# EasyEDA Pro project V5_R03_PowerCarrier.epro

# Board V5_R03_PowerCarrier
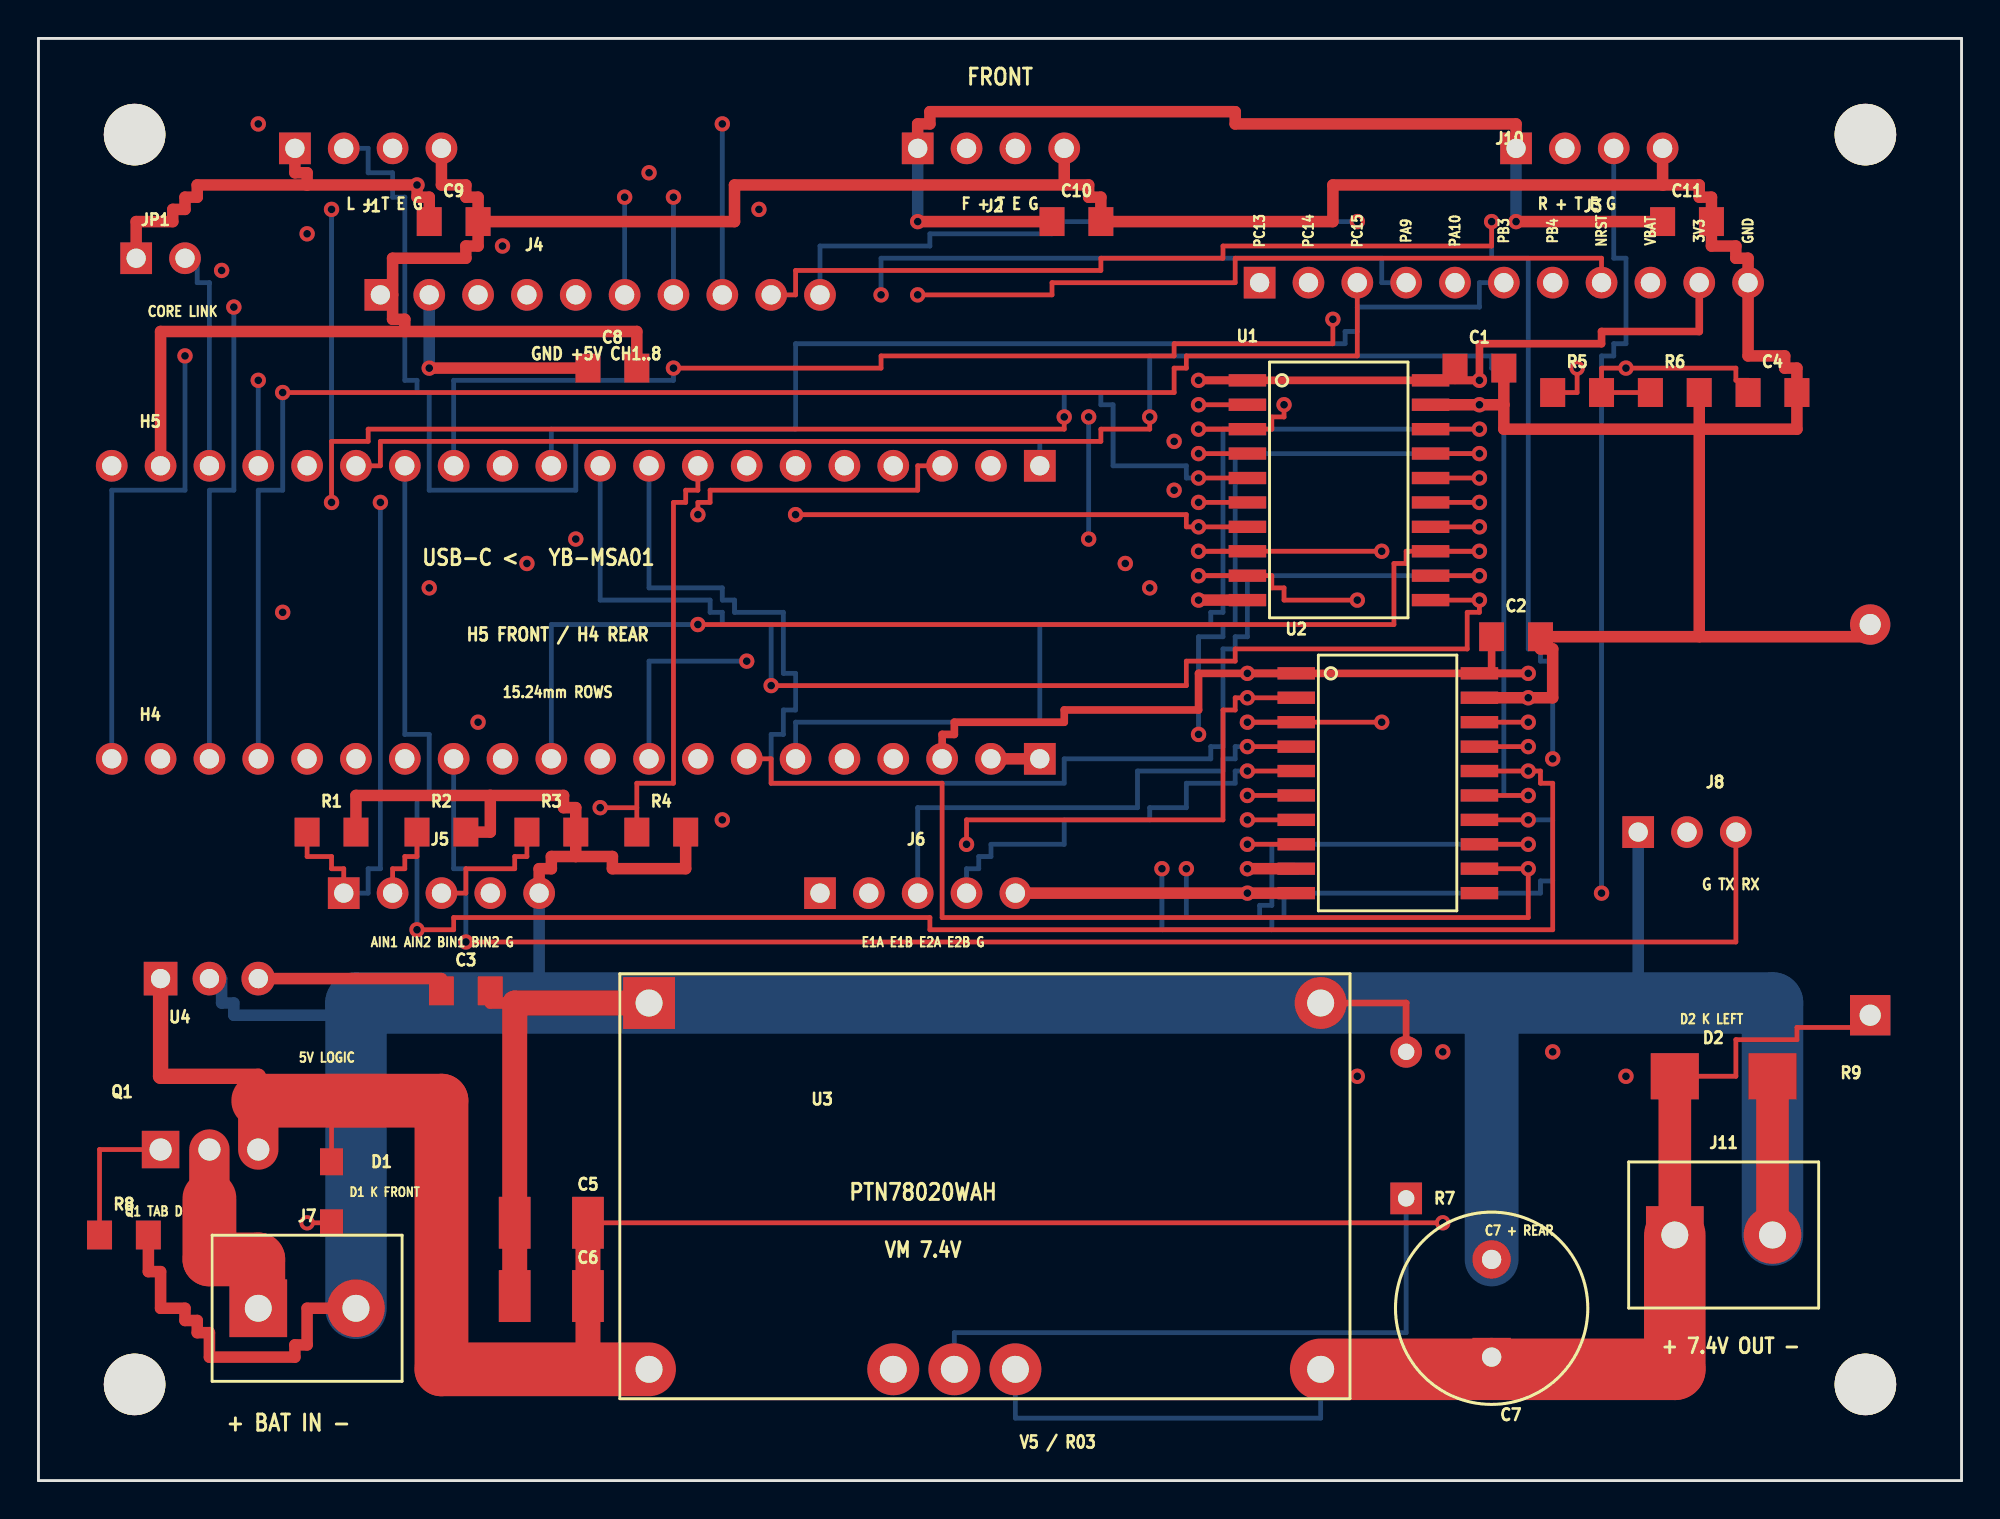
[diagram p0: board, top side]
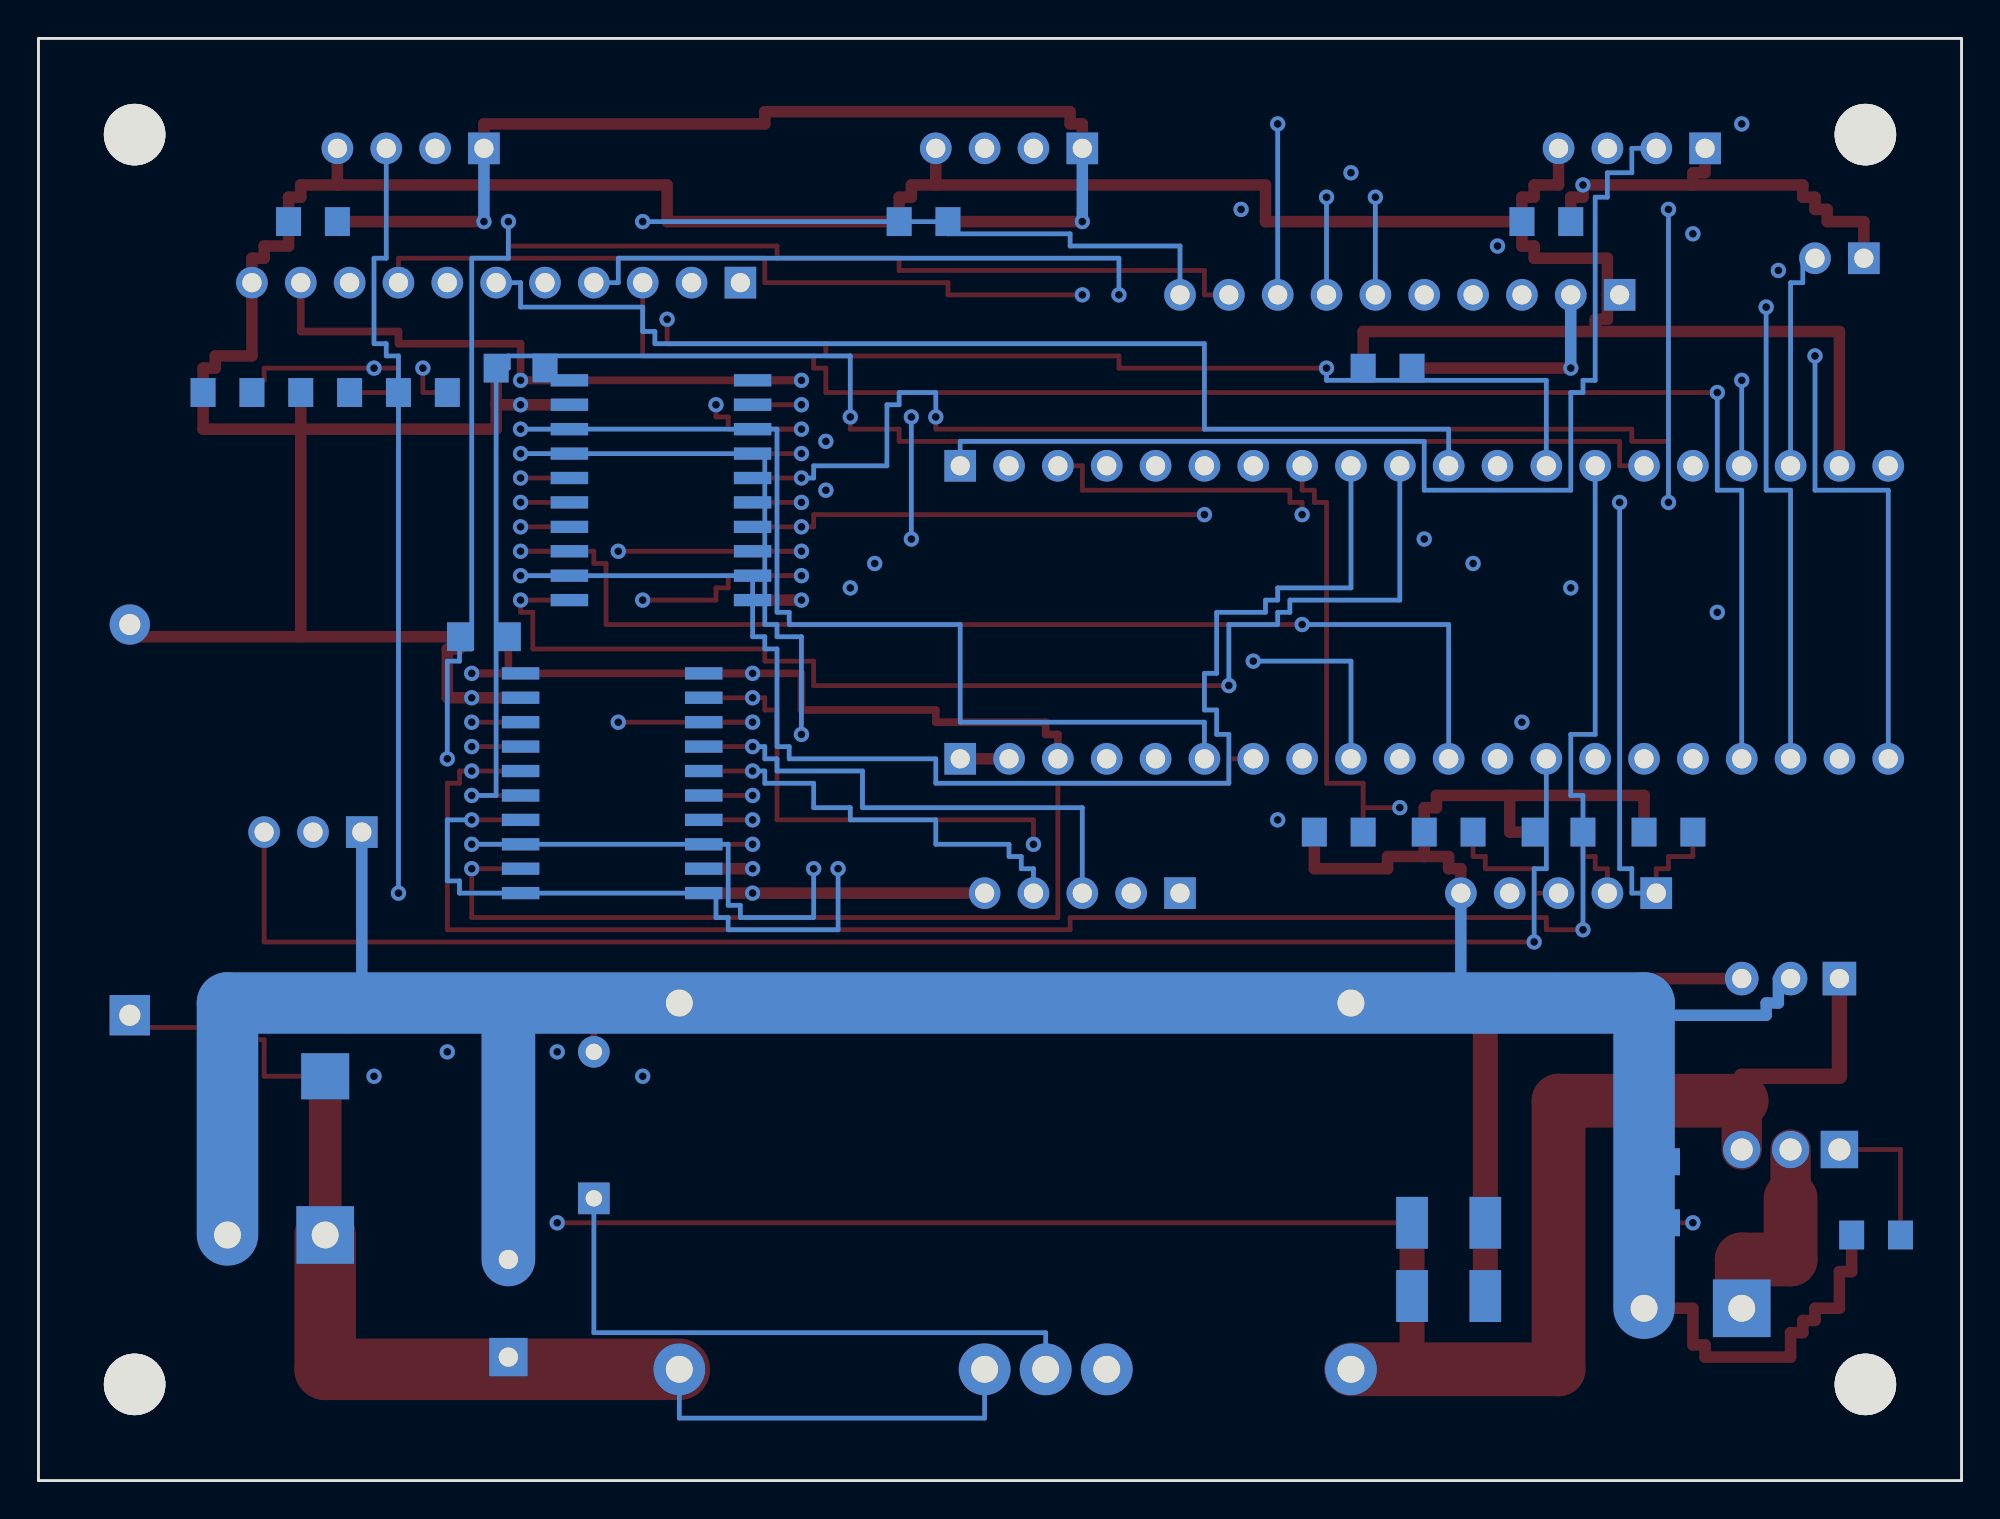
[diagram p1: board, bottom side, seen from below]

Outline 100 x 75 mm; copper layers: Top Layer, In1.Cu, In2.Cu, Bottom Layer. Coordinates in mm from the lower left corner of the outline.
Outline path: 0,75 100,75 100,0 0,0 0,75
Stack: Top Layer 0.035mm / Bottom Layer 0.035mm

## Design rules (mm)
spacing copperThickness1oz (default): track to track 0.102, other pairs 0.152 to 0.3
track width copperThickness1oz (default): min 0.2, default 0.25, max 3.5
differential pair differentialPair (default): width min 0.127, default 2.54, max 2.54; gap min 0.127, default 0.152

## Placement (name value [footprint] x y rotation side)
C1  100n  [C1_100n]  74.93 57.86 0 top
C2  100n  [C2_100n]  76.84 43.89 0 top
C3  10u/10V  [C3_10u/10V]  22.22 25.47 0 top
C4  100n  [C4_100n]  90.17 56.58 0 top
C5  10u_50V_X7R_1210  [C5_10u_50V_X7R_1210]  28.57 13.41 0 top
C6  10u_50V_X7R_1210  [C6_10u_50V_X7R_1210]  28.57 9.59 0 top
C7  EEUFC1V331_330u_35V  [C7_EEUFC1V331_330u_35V]  75.56 6.42 0 top
C8  100n  [C8_100n]  29.84 57.86 0 top
C9  100n  [C9_100n]  21.59 65.47 0 top
C10  100n  [C10_100n]  53.97 65.47 0 top
C11  100n  [C11_100n]  85.72 65.47 0 top
D1  BZT52C12_SOD123  [D1_BZT52C12_SOD123]  15.24 16.58 0 top
D2  SMBJ8.0A  [D2_SMBJ8.0A]  85.09 21.03 0 top
H4  SOCKET_1x20  [H4_SOCKET_1x20]  3.81 37.53 0 top
H5  SOCKET_1x20  [H5_SOCKET_1x20]  3.81 52.78 0 top
J1  SONAR_L  [J1_SONAR_L]  13.33 69.28 0 top
J2  SONAR_F  [J2_SONAR_F]  45.72 69.28 0 top
J3  SONAR_R  [J3_SONAR_R]  76.84 69.28 0 top
J4  GANV005_M0  [J4_GANV005_M0]  17.78 61.67 0 top
J5  D157B_CONTROL  [J5_D157B_CONTROL]  15.88 30.55 0 top
J6  D157B_ENCODER  [J6_D157B_ENCODER]  40.64 30.55 0 top
J7  BATTERY_IN_5.08  [J7_BATTERY_IN_5.08]  11.43 8.96 0 top
J8  RDK_UART_3V3  [J8_RDK_UART_3V3]  83.19 33.72 0 top
J10  EXPANSION  [J10_EXPANSION]  63.5 62.3 0 top
J11  VM_OUT_5.08  [J11_VM_OUT_5.08]  85.09 12.77 0 top
JP1  CORE_POWER_LINK  [JP1_CORE_POWER_LINK]  5.08 63.57 0 top
MH1  M3  [MountingHole]  5 70 0 top
MH2  M3  [MountingHole]  95 70 0 top
MH3  M3  [MountingHole]  5 5 0 top
MH4  M3  [MountingHole]  95 5 0 top
Q1  IRF4905PbF_TO220  [Q1_IRF4905PbF_TO220]  6.35 17.22 0 top
R1  47k  [R1_47k]  15.24 33.72 0 top
R2  47k  [R2_47k]  20.95 33.72 0 top
R3  47k  [R3_47k]  26.67 33.72 0 top
R4  47k  [R4_47k]  32.38 33.72 0 top
R5  47k  [R5_47k]  80.01 56.58 0 top
R6  10k  [R6_10k]  85.09 56.58 0 top
R7  7.50k_0.1pct  [R7_7.50k_0.1pct]  71.12 14.68 0 top
R8  10k  [R8_10k]  4.44 12.77 0 top
R9  68R_3W_flameproof  [R9_68R_3W_flameproof]  95.25 24.2 0 top
U1  SN74LVC245ADW  [U1_SN74LVC245ADW]  62.87 57.22 0 top
U2  SN74LVC245ADW  [U2_SN74LVC245ADW]  65.41 41.98 0 top
U3  PTN78020WAH_EUK  [U3_PTN78020WAH_EUK]  31.75 24.83 0 top
U4  TSR_1-2450  [U4_TSR_1-2450]  6.35 26.11 0 top

## Footprints (pads in the part's own frame, mm; a bottom-side part is the same pattern mirrored in y, then rotated)
C1_100n
  rect 1.3x1.5 hole 0.001: 1(-1.27,0) 2(1.27,0)
C2_100n
  rect 1.3x1.5 hole 0.001: 1(-1.27,0) 2(1.27,0)
C3_10u/10V
  rect 1.3x1.5 hole 0.001: 1(-1.27,0) 2(1.27,0)
C4_100n
  rect 1.3x1.5 hole 0.001: 1(-1.27,0) 2(1.27,0)
C5_10u_50V_X7R_1210
  rect 1.65x2.7 hole 0.001: 1(0,0) 2(-3.81,0)
C6_10u_50V_X7R_1210
  rect 1.65x2.7 hole 0.001: 1(0,0) 2(-3.81,0)
C7_EEUFC1V331_330u_35V
  rect 2x2 hole 1: 1(0,0)
  round 2 hole 1: 2(0,5.08)
C8_100n
  rect 1.3x1.5 hole 0.001: 1(-1.27,0) 2(1.27,0)
C9_100n
  rect 1.3x1.5 hole 0.001: 1(-1.27,0) 2(1.27,0)
C10_100n
  rect 1.3x1.5 hole 0.001: 1(-1.27,0) 2(1.27,0)
C11_100n
  rect 1.3x1.5 hole 0.001: 1(-1.27,0) 2(1.27,0)
D1_BZT52C12_SOD123
  rect 1.2x1.4 hole 0.001: 1(0,0) 2(0,-3.175)
D2_SMBJ8.0A
  rect 2.5x2.4 hole 0.001: 1(0,0) 2(5.08,0)
H4_SOCKET_1x20
  rect 1.65x1.65 hole 1: 1(48.26,0)
  round 1.65 hole 1: 2(45.72,0) 3(43.18,0) 4(40.64,0) 5(38.1,0) 6(35.56,0) 7(33.02,0) 8(30.48,0) 9(27.94,0) 10(25.4,0) 11(22.86,0) 12(20.32,0) 13(17.78,0) 14(15.24,0) 15(12.7,0) 16(10.16,0) 17(7.62,0) 18(5.08,0) 19(2.54,0) 20(0,0)
H5_SOCKET_1x20
  rect 1.65x1.65 hole 1: 1(48.26,0)
  round 1.65 hole 1: 2(45.72,0) 3(43.18,0) 4(40.64,0) 5(38.1,0) 6(35.56,0) 7(33.02,0) 8(30.48,0) 9(27.94,0) 10(25.4,0) 11(22.86,0) 12(20.32,0) 13(17.78,0) 14(15.24,0) 15(12.7,0) 16(10.16,0) 17(7.62,0) 18(5.08,0) 19(2.54,0) 20(0,0)
J1_SONAR_L
  rect 1.65x1.65 hole 1: 1(0,0)
  round 1.65 hole 1: 2(2.54,0) 3(5.08,0) 4(7.62,0)
J2_SONAR_F
  rect 1.65x1.65 hole 1: 1(0,0)
  round 1.65 hole 1: 2(2.54,0) 3(5.08,0) 4(7.62,0)
J3_SONAR_R
  rect 1.65x1.65 hole 1: 1(0,0)
  round 1.65 hole 1: 2(2.54,0) 3(5.08,0) 4(7.62,0)
J4_GANV005_M0
  rect 1.65x1.65 hole 1: 1(0,0)
  round 1.65 hole 1: 2(2.54,0) 3(5.08,0) 4(7.62,0) 5(10.16,0) 6(12.7,0) 7(15.24,0) 8(17.78,0) 9(20.32,0) 10(22.86,0)
J5_D157B_CONTROL
  rect 1.65x1.65 hole 1: 1(0,0)
  round 1.65 hole 1: 2(2.54,0) 3(5.08,0) 4(7.62,0) 5(10.16,0)
J6_D157B_ENCODER
  rect 1.65x1.65 hole 1: 1(0,0)
  round 1.65 hole 1: 2(2.54,0) 3(5.08,0) 4(7.62,0) 5(10.16,0)
J7_BATTERY_IN_5.08
  rect 3x3 hole 1.4: 1(0,0)
  round 3 hole 1.4: 2(5.08,0)
J8_RDK_UART_3V3
  rect 1.65x1.65 hole 1: 1(0,0)
  round 1.65 hole 1: 2(2.54,0) 3(5.08,0)
J10_EXPANSION
  rect 1.65x1.65 hole 1: 1(0,0)
  round 1.65 hole 1: 2(2.54,0) 3(5.08,0) 4(7.62,0) 5(10.16,0) 6(12.7,0) 7(15.24,0) 8(17.78,0) 9(20.32,0) 10(22.86,0) 11(25.4,0)
J11_VM_OUT_5.08
  rect 3x3 hole 1.4: 1(0,0)
  round 3 hole 1.4: 2(5.08,0)
JP1_CORE_POWER_LINK
  rect 1.65x1.65 hole 1: 1(0,0)
  round 1.65 hole 1: 2(2.54,0)
MountingHole
  round 3.2 hole 3.2: (0,0)
Q1_IRF4905PbF_TO220
  rect 1.95x1.95 hole 1.15: 1(0,0)
  round 1.95 hole 1.15: 2(2.54,0) 3(5.08,0)
R1_47k
  rect 1.3x1.5 hole 0.001: 1(-1.27,0) 2(1.27,0)
R2_47k
  rect 1.3x1.5 hole 0.001: 1(-1.27,0) 2(1.27,0)
R3_47k
  rect 1.3x1.5 hole 0.001: 1(-1.27,0) 2(1.27,0)
R4_47k
  rect 1.3x1.5 hole 0.001: 1(-1.27,0) 2(1.27,0)
R5_47k
  rect 1.3x1.5 hole 0.001: 1(-1.27,0) 2(1.27,0)
R6_10k
  rect 1.3x1.5 hole 0.001: 1(-1.27,0) 2(1.27,0)
R7_7.50k_0.1pct
  rect 1.65x1.65 hole 0.85: 1(0,0)
  round 1.65 hole 0.85: 2(0,7.62)
R8_10k
  rect 1.3x1.5 hole 0.001: 1(-1.27,0) 2(1.27,0)
R9_68R_3W_flameproof
  rect 2.1x2.1 hole 1.1: 1(0,0)
  round 2.1 hole 1.1: 2(0,20.32)
U1_SN74LVC245ADW
  rect 1.95x0.64 hole 0.001: 1(0,0) 2(0,-1.27) 3(0,-2.54) 4(0,-3.81) 5(0,-5.08) 6(0,-6.35) 7(0,-7.62) 8(0,-8.89) 9(0,-10.16) 10(0,-11.43) 11(9.525,-11.43) 12(9.525,-10.16) 13(9.525,-8.89) 14(9.525,-7.62) 15(9.525,-6.35) 16(9.525,-5.08) 17(9.525,-3.81) 18(9.525,-2.54) 19(9.525,-1.27) 20(9.525,0)
U2_SN74LVC245ADW
  rect 1.95x0.64 hole 0.001: 1(0,0) 2(0,-1.27) 3(0,-2.54) 4(0,-3.81) 5(0,-5.08) 6(0,-6.35) 7(0,-7.62) 8(0,-8.89) 9(0,-10.16) 10(0,-11.43) 11(9.525,-11.43) 12(9.525,-10.16) 13(9.525,-8.89) 14(9.525,-7.62) 15(9.525,-6.35) 16(9.525,-5.08) 17(9.525,-3.81) 18(9.525,-2.54) 19(9.525,-1.27) 20(9.525,0)
U3_PTN78020WAH_EUK
  rect 2.7x2.7 hole 1.4: 1(0,0)
  round 2.7 hole 1.4: 2(0,-19.05) 3(12.7,-19.05) 4(15.875,-19.05) 5(19.05,-19.05) 6(34.925,-19.05) 7(34.925,0)
U4_TSR_1-2450
  rect 1.75x1.75 hole 1: 1(0,0)
  round 1.75 hole 1: 2(2.54,0) 3(5.08,0)

## Nets
3V3: C1.1 C2.1 H4.3 H5.20 J10.10 U1.1 U1.20 U2.1 U2.20
5V: C3.1 C8.1 C9.1 C10.1 C11.1 J1.1 J2.1 J3.1 J4.2 JP1.1 U4.3
GND: C1.2 C2.2 C3.2 C4.2 C5.2 C6.2 C7.2 C8.2 C9.2 C10.2 C11.2 D2.2 H4.1 H4.2 H5.19 J1.4 J2.4 J3.4 J4.1 J5.5 J6.5 J7.2 J8.1 J10.11 J11.2 R1.2 R2.2 R3.2 R4.2 R6.2 R7.2 R8.2 R9.2 U1.10 U1.19 U2.9 U2.10 U2.19 U3.1 U3.7 U4.2
VBAT: H4.20 J10.9
VIN_PROT: C5.1 C6.1 D1.1 Q1.3 R5.1 U3.2 U4.1
BAT_SW: J7.1 Q1.2
CH1: J4.3 U1.2
CH2: J4.4 U1.3
CH3: J4.5 U1.4
CH4: J4.6 U1.5
CH5: J4.7 U1.6
CH6: J4.8 U1.7
CH7: J4.9 U1.8
CH8: J4.10 U1.9
CORE_5V: H5.18 JP1.2
E1A: J6.1 U2.2
E1B: J6.2 U2.3
E2A: J6.3 U2.4
E2B: J6.4 U2.5
EF: J2.3 U2.7
EL: J1.3 U2.6
ER: J3.3 U2.8
INH_NC: U3.3
NC_U2_B8: U2.11
NRST: H4.4 J10.8
PA0: H4.16 J5.2 R2.1
PA1: H4.15 J5.3 R3.1
PA2: H4.14 J8.2
PA3: H4.13 J8.3
PA4: C4.1 H4.12 R5.2 R6.1
PA5: H4.11 U1.13
PA6: H4.10 U2.18
PA7: H4.9 U2.17
PA8: H5.5 J5.1 R1.1
PA9: H5.6 J10.4
PA10: H5.7 J10.5
PA11: H5.8 J5.4 R4.1
PA12: H5.9 U1.12
PA15: H5.10 U1.11
PB0: H4.8 J3.2
PB1: H4.7 U2.12
PB3: H5.11 J10.6
PB4: H5.12 J10.7
PB5: H5.13 U1.14
PB6: H5.14 U2.16
PB7: H5.15 U2.15
PB8: H5.16 U1.16
PB9: H5.17 U1.15
PB10: H4.6 U1.18
PB11: H4.5 U1.17
PB12: H5.1 J1.2
PB13: H5.2 U2.14
PB14: H5.3 J2.2
PB15: H5.4 U2.13
PC13: H4.19 J10.1
PC14: H4.18 J10.2
PC15: H4.17 J10.3
PGATE: D1.2 Q1.1 R8.1
VADJ: R7.1 U3.4
VM7V4: C7.1 D2.1 J11.1 R9.1 U3.5 U3.6

## Via types
v1: diameter 0.8, hole 0.4, Top Layer to Bottom Layer, 105 vias

## Routing (per net, layer and track width the routed paths; a pad name or vN(x,y) marks a point on that pad's centre or on a via; arc(x,y) is an arc through that point)
3V3: length 157.5
  Top Layer w0.4: J10.10 86.36,59.76 81.28,59.76 81.28,59.12 74.93,59.12 v1(74.93,57.22) ; U2.20 v1(77.47,41.98) v1(62.87,41.98) ; v1(74.93,57.22) U1.20 ; v1(74.93,57.22) 73.66,57.22 ; C1.1 73.66,57.22 ; 73.66,57.22 v1(60.32,57.22) U1.1 ; H4.3 46.99,38.81 47.62,38.81 47.62,39.44 53.34,39.44 53.34,40.08 60.32,40.08 60.32,41.98 v1(62.87,41.98) ; v1(62.87,41.98) U2.1 ; C2.1 75.56,41.98
  In1.Cu w0.4: v1(62.87,41.98) U1.1 v1(60.32,57.22)
  In2.Cu w0.4: H5.20 3.81,55.31 21.59,55.31 21.59,55.95 41.28,55.95 41.28,57.22 v1(60.32,57.22)
5V: length 187.3
  Top Layer w0.6: 84.46,65.47 v1(76.84,65.47) ; C9.1 20.32,66.75 19.69,66.75 v1(19.69,67.38) 13.97,67.38 ; 13.97,67.38 13.97,68.02 13.33,68.02 J1.1 ; 13.97,67.38 8.25,67.38 8.25,66.75 7.62,66.75 7.62,66.11 6.98,66.11 6.98,65.47 5.08,65.47 JP1.1 ; C8.1 v1(20.32,57.86) ; U4.3 20.95,26.11 C3.1 ; C10.1 v1(45.72,65.47) ; J2.1 45.72,70.56 46.35,70.56 46.35,71.19 62.23,71.19 62.23,70.56 76.84,70.56 J3.1
  In1.Cu w0.6: J4.2 19.69,61.67 v1(19.69,67.38) ; U4.3 10.8,26.11 10.8,27.38 10.16,27.38 10.16,28.01 1.91,28.01 1.91,54.05 2.54,54.05 2.54,54.68 5.08,54.68 JP1.1
  In2.Cu w0.6: v1(19.69,67.38) 29.21,67.38 29.21,69.28 J2.1
  Bottom Layer w0.6: v1(20.32,57.86) J4.2 ; v1(45.72,65.47) J2.1 ; v1(76.84,65.47) J3.1
GND: length 502.3
  Top Layer w0.35: U3.7 71.12,24.83 R7.2
  Top Layer w0.6: 27.94,32.45 26.67,32.45 26.67,31.82 26.03,31.82 J5.5 ; 27.94,32.45 29.84,32.45 29.84,31.82 33.66,31.82 R4.2 ; 27.94,32.45 R3.2 27.94,35 27.31,35 27.31,35.63 23.5,35.63 ; 76.2,55.95 76.2,54.68 91.44,54.68 C4.2 91.44,57.86 90.81,57.86 90.81,58.49 88.9,58.49 J10.11 88.9,63.57 88.26,63.57 88.26,64.2 87,64.2 C11.2 87,66.75 86.36,66.75 86.36,67.38 84.46,67.38 ; 76.2,55.95 C1.2 ; 76.2,55.95 v1(74.93,55.95) U1.19 ; H5.19 6.35,59.76 19.05,59.76 ; 84.46,67.38 67.31,67.38 67.31,65.47 C10.2 55.25,66.75 54.61,66.75 54.61,67.38 53.34,67.38 ; 84.46,67.38 J3.4 ; U2.10 v1(62.87,30.55) J6.5 ; U1.10 v1(60.32,45.79) ; 53.34,67.38 36.19,67.38 36.19,65.47 C9.2 ; 53.34,67.38 J2.4 ; J4.1 18.42,61.67 ; 18.42,61.67 18.42,63.57 22.22,63.57 22.22,64.2 22.86,64.2 C9.2 ; 18.42,61.67 18.42,60.39 19.05,60.39 19.05,59.76 ; 23.5,35.63 23.5,33.72 R2.2 ; 23.5,35.63 16.51,35.63 R1.2 ; C8.2 31.12,59.76 19.05,59.76 ; H4.1 H4.2 ; C9.2 22.86,66.75 22.22,66.75 22.22,67.38 20.95,67.38 J1.4 ; U2.9 v1(62.87,31.82) ; 5.72,12.77 5.72,10.87 6.35,10.87 6.35,8.96 7.62,8.96 7.62,8.32 8.25,8.32 8.25,7.69 8.89,7.69 8.89,6.42 13.33,6.42 13.33,7.06 13.97,7.06 13.97,8.96 J7.2 ; 24.77,24.83 23.5,24.83 23.5,25.47 ; R6.2 86.36,43.89 ; R9.2 95.25,43.89 78.1,43.89 78.1,43.25 78.74,43.25 78.74,40.71 v1(77.47,40.71) U2.19
  Top Layer w1.3: C6.2 24.77,24.83 U3.1
  Top Layer w1.7: D2.2 J11.2
  In1.Cu w0.6: U3.7 62.87,24.83 v1(62.87,30.55) v1(62.87,31.82) 61.59,31.82 61.59,45.79 v1(60.32,45.79) ; J8.1 83.19,40.71 v1(77.47,40.71) ; J6.5 52.07,30.55 H4.1
  Bottom Layer w0.6: 16.51,24.2 10.16,24.2 10.16,24.83 9.53,24.83 9.53,26.11 U4.2 ; J8.1 83.19,24.83 ; J5.5 26.03,24.83
  Bottom Layer w2.8: C7.2 75.56,24.83
  Bottom Layer w3.2: J7.2 16.51,24.83 90.17,24.83 J11.2
VBAT: length 104.8
  In2.Cu w0.25: v1(7.62,58.49) 19.69,58.49 19.69,59.12 83.82,59.12 J10.9
  Bottom Layer w0.25: H4.20 3.81,51.5 7.62,51.5 v1(7.62,58.49)
VIN_PROT: length 157.5
  Top Layer w0.25: R5.1 80.01,56.58 v1(80.01,57.86) ; C5.1 v1(73.03,13.41) ; D1.1 15.24,19.75
  Top Layer w0.8: U4.1 6.35,21.03 11.43,21.03 11.43,19.75
  Top Layer w1.3: C5.1 28.57,5.78
  Top Layer w2.1: Q1.3 11.43,19.75
  Top Layer w2.8: 11.43,19.75 20.95,19.75 20.95,5.78 U3.2
  In1.Cu w0.25: v1(80.01,57.86) 80.01,53.41 76.84,53.41 76.84,42.61 76.2,42.61 76.2,13.41 v1(73.03,13.41)
BAT_SW: length 10.8
  Top Layer w2.1: 8.89,14.68 Q1.2
  Top Layer w2.8: J7.1 11.43,11.5 8.89,11.5 8.89,14.68
CH1: length 68.6
  Top Layer w0.25: U1.2 v1(60.32,55.95)
  In1.Cu w0.25: J4.3 22.86,65.47 24.77,65.47 24.77,64.84 26.67,64.84 26.67,55.95 27.31,55.95 27.31,54.05 27.94,54.05 v1(27.94,48.97)
  In2.Cu w0.25: v1(60.32,55.95) 59.69,55.95 59.69,56.58 57.15,56.58 57.15,55.95 56.51,55.95 56.51,55.31 v1(54.61,55.31) ; v1(54.61,48.97) v1(27.94,48.97)
  Bottom Layer w0.25: v1(54.61,55.31) v1(54.61,48.97)
CH2: length 76.2
  Top Layer w0.25: v1(64.77,55.95) 64.77,55.31 64.13,55.31 64.13,54.68 v1(60.32,54.68) U1.3
  In1.Cu w0.25: v1(64.77,55.95) 64.13,55.95 64.13,58.49 61.59,58.49 61.59,59.12 56.51,59.12 v1(56.51,47.69) ; v1(25.4,47.69) J4.4
  In2.Cu w0.25: v1(56.51,47.69) v1(25.4,47.69)
CH3: length 99.1
  Top Layer w0.25: U1.4 v1(60.32,53.41)
  In1.Cu w0.25: J4.5 27.94,71.19 17.78,71.19 17.78,70.56 17.14,70.56 17.14,62.94 16.51,62.94 16.51,54.05 20.32,54.05 v1(20.32,46.42) ; v1(57.78,46.42) 57.78,52.78 59.69,52.78 59.69,53.41 v1(60.32,53.41)
  In2.Cu w0.25: v1(57.78,46.42) v1(20.32,46.42)
CH4: length 94
  Top Layer w0.25: U1.5 v1(60.32,52.14) ; v1(53.34,55.31) 53.34,54.68 17.14,54.68 17.14,54.05 15.24,54.05 v1(15.24,50.87)
  In2.Cu w0.25: v1(30.48,66.75) 29.84,66.75 29.84,66.11 v1(15.24,66.11)
  Bottom Layer w0.25: v1(15.24,50.87) v1(15.24,66.11) ; v1(60.32,52.14) 59.69,52.14 59.69,52.78 55.88,52.78 55.88,55.95 55.25,55.95 55.25,56.58 53.34,56.58 v1(53.34,55.31) ; v1(30.48,66.75) J4.6
CH5: length 104.1
  Top Layer w0.25: U1.6 v1(60.32,50.87)
  In1.Cu w0.25: v1(13.97,64.84) 13.97,54.05 12.7,54.05 v1(12.7,45.16)
  In2.Cu w0.25: v1(60.32,50.87) 59.69,50.87 59.69,50.23 59.06,50.23 59.06,45.16 57.15,45.16 57.15,45.79 33.66,45.79 33.66,45.16 v1(12.7,45.16) ; v1(33.02,66.75) 31.75,66.75 31.75,66.11 31.12,66.11 31.12,65.47 15.88,65.47 15.88,64.84 v1(13.97,64.84)
  Bottom Layer w0.25: v1(33.02,66.75) J4.7
CH6: length 142.2
  Top Layer w0.25: U1.7 v1(60.32,49.6) 59.69,49.6 59.69,50.23 v1(39.37,50.23)
  In1.Cu w0.25: v1(39.37,50.23) 39.37,40.71 38.74,40.71 38.74,40.08 38.1,40.08 38.1,36.27 36.83,36.27 36.83,33.72 36.19,33.72 36.19,33.09 17.78,33.09 17.78,38.81 10.16,38.81 10.16,57.86 10.8,57.86 10.8,58.49 11.43,58.49 v1(11.43,70.56)
  In2.Cu w0.25: v1(11.43,70.56) v1(35.56,70.56)
  Bottom Layer w0.25: v1(35.56,70.56) J4.8
CH7: length 134.6
  Top Layer w0.25: v1(69.85,48.33) v1(60.32,48.33) U1.8 ; v1(75.56,65.47) 75.56,64.2 61.59,64.2 61.59,63.57 55.25,63.57 55.25,62.94 39.37,62.94 39.37,61.67 J4.9
  In1.Cu w0.25: v1(73.03,22.3) 73.03,48.33 v1(69.85,48.33) ; v1(78.74,22.3) v1(78.74,37.53)
  In2.Cu w0.25: v1(73.03,22.3) v1(78.74,22.3)
  Bottom Layer w0.25: v1(78.74,37.53) 78.74,42.61 78.1,42.61 78.1,43.25 77.47,43.25 77.47,63.57 75.56,63.57 v1(75.56,65.47)
CH8: length 144.8
  Top Layer w0.25: v1(68.58,45.79) 64.77,45.79 64.77,46.42 64.13,46.42 64.13,47.06 v1(60.32,47.06) U1.9
  In1.Cu w0.25: v1(68.58,65.47) 68.58,64.2 73.03,64.2 73.03,63.57 74.93,63.57 74.93,59.12 80.65,59.12 80.65,58.49 81.28,58.49 81.28,41.98 83.82,41.98 83.82,41.34 84.46,41.34 84.46,21.03 v1(82.55,21.03) ; v1(68.58,45.79) v1(68.58,21.03)
  In2.Cu w0.25: v1(68.58,21.03) v1(82.55,21.03)
  Bottom Layer w0.25: J4.10 40.64,64.2 46.35,64.2 46.35,64.84 52.71,64.84 52.71,65.47 v1(68.58,65.47)
CORE_5V: length 12.1
  Bottom Layer w0.25: H5.18 8.89,62.3 8.25,62.3 8.25,63.57 JP1.2
E1A: length 34.9
  Top Layer w0.25: v1(48.26,33.09) 48.26,34.36 61.59,34.36 61.59,40.08 62.23,40.08 62.23,40.71 v1(62.87,40.71) U2.2
  In2.Cu w0.25: J6.1 41.91,30.55 41.91,31.82 46.99,31.82 46.99,33.09 v1(48.26,33.09)
E1B: length 66.7
  Top Layer w0.25: U2.3 v1(62.87,39.44) v1(69.85,39.44)
  In1.Cu w0.25: v1(69.85,39.44) 69.85,20.39 69.22,20.39 69.22,19.75 55.88,19.75 55.88,28.64 43.18,28.64 J6.2
E2A: length 27.3
  Top Layer w0.25: U2.4 v1(62.87,38.17)
  Bottom Layer w0.25: J6.3 45.72,35 57.15,35 57.15,36.9 61.59,36.9 61.59,37.53 62.23,37.53 62.23,38.17 v1(62.87,38.17)
E2B: length 23.5
  Top Layer w0.25: U2.5 v1(62.87,36.9)
  Bottom Layer w0.25: J6.4 48.26,31.82 48.9,31.82 48.9,32.45 49.53,32.45 49.53,33.09 53.34,33.09 53.34,34.36 57.78,34.36 57.78,35 59.69,35 59.69,36.27 62.23,36.27 62.23,36.9 v1(62.87,36.9)
EF: length 90.2
  Top Layer w0.25: U2.7 v1(62.87,34.36)
  In1.Cu w0.25: v1(31.75,68.02) 31.75,55.95 31.12,55.95 31.12,54.05 30.48,54.05 30.48,34.36 v1(35.56,34.36)
  In2.Cu w0.25: v1(62.87,34.36) v1(35.56,34.36) ; v1(31.75,68.02) 49.53,68.02 49.53,69.28 J2.3
EL: length 84.5
  Top Layer w0.25: U2.6 v1(62.87,35.63)
  In1.Cu w0.25: v1(22.86,39.44) 22.86,54.05 22.22,54.05 22.22,59.12 21.59,59.12 21.59,62.94 22.22,62.94 22.22,70.56 18.42,70.56 18.42,69.28
  In2.Cu w0.25: v1(22.86,39.44) 22.86,36.27 29.84,36.27 29.84,35.63 v1(62.87,35.63)
ER: length 64.1
  Top Layer w0.25: U2.8 v1(62.87,33.09)
  In2.Cu w0.25: v1(62.87,33.09) 63.5,33.09 63.5,32.45 64.13,32.45 64.13,30.55 v1(81.28,30.55)
  Bottom Layer w0.25: J3.3 81.91,63.57 82.55,63.57 82.55,59.12 81.91,59.12 81.91,58.49 81.28,58.49 v1(81.28,30.55)
NRST: length 64.1
  Top Layer w0.25: v1(45.72,61.67) 52.71,61.67 52.71,62.3 62.23,62.3 62.23,63.57 81.28,63.57 J10.8
  In1.Cu w0.25: H4.4 44.45,51.5 45.72,51.5 v1(45.72,61.67)
PA0: length 15.9
  Top Layer w0.25: R2.1 19.69,32.45 19.05,32.45 19.05,31.82 18.42,31.82 J5.2
  In1.Cu w0.25: H4.16 13.97,31.82 17.14,31.82 17.14,30.55 J5.2
PA1: length 19
  Top Layer w0.25: J5.3 22.22,30.55 22.22,31.82 24.77,31.82 24.77,32.45 25.4,32.45 R3.1
  In1.Cu w0.25: H4.15 16.51,32.45 17.78,32.45 17.78,31.82 19.69,31.82 19.69,30.55 J5.3
PA2: length 79.4
  In2.Cu w0.25: H4.14 20.32,37.53 20.32,36.27 21.59,36.27 21.59,32.45 22.22,32.45 22.22,29.28 85.72,29.28 J8.2
PA3: length 81.9
  Top Layer w0.25: v1(22.22,28.01) 88.26,28.01 88.26,33.72
  Bottom Layer w0.25: H4.13 21.59,31.82 22.22,31.82 v1(22.22,28.01)
PA4: length 91.4
  Top Layer w0.25: R6.1 R5.2 81.28,57.86 v1(82.55,57.86) 88.26,57.86 88.26,57.22 88.9,57.22 C4.1
  In2.Cu w0.25: H4.12 25.4,37.53 25.4,38.81 35.56,38.81 35.56,43.89 55.25,43.89 55.25,44.52 82.55,44.52 v1(82.55,57.86)
PA5: length 61.6
  Top Layer w0.25: v1(34.29,44.52) 70.49,44.52 70.49,47.69 71.12,47.69 71.12,48.33 v1(74.93,48.33) U1.13
  Bottom Layer w0.25: v1(34.29,44.52) 26.67,44.52 H4.11
PA6: length 62.9
  Top Layer w0.25: U2.18 v1(77.47,39.44)
  In2.Cu w0.25: v1(77.47,39.44) 76.84,39.44 76.84,40.08 76.2,40.08 76.2,43.25 62.23,43.25 62.23,42.61 61.59,42.61 61.59,41.98 60.32,41.98 60.32,41.34 40.64,41.34 40.64,36.27 30.48,36.27 30.48,37.53 H4.10
PA7: length 62.9
  Top Layer w0.25: U2.17 v1(77.47,38.17)
  In2.Cu w0.25: v1(77.47,38.17) 78.1,38.17 78.1,38.81 78.74,38.81 78.74,43.89 61.59,43.89 61.59,43.25 60.96,43.25 60.96,42.61 v1(36.83,42.61)
  Bottom Layer w0.25: v1(36.83,42.61) 31.75,42.61 H4.9
PA8: length 53.3
  Top Layer w0.25: J5.1 15.88,31.82 15.24,31.82 15.24,32.45 13.97,32.45 R1.1
  In2.Cu w0.25: v1(17.78,50.87) 24.77,50.87 24.77,51.5 40.64,51.5 40.64,52.78 H5.5
  Bottom Layer w0.25: v1(17.78,50.87) 17.78,31.82 17.14,31.82 17.14,30.55 J5.1
PA9: length 43.8
  In1.Cu w0.25: H5.6 39.37,59.76 40,59.76 40,60.39 41.91,60.39 41.91,61.67 v1(43.81,61.67)
  Bottom Layer w0.25: J10.4 69.85,62.3 69.85,63.57 43.81,63.57 v1(43.81,61.67)
PA10: length 48.9
  In1.Cu w0.25: H5.7 36.83,59.76 37.47,59.76 37.47,60.39 39.37,60.39 39.37,62.94 43.81,62.94 43.81,63.57 72.39,63.57 72.39,62.3 J10.5
PA11: length 34.3
  Top Layer w0.25: H5.8 34.29,51.5 33.66,51.5 33.66,50.87 33.02,50.87 33.02,36.27 31.12,36.27 31.12,33.72 ; v1(29.21,35) 31.12,35
  In2.Cu w0.25: J5.4 23.5,35 v1(29.21,35)
PA12: length 75.6
  Top Layer w0.25: U1.12 v1(74.93,47.06)
  Bottom Layer w0.25: H5.9 31.75,46.42 35.56,46.42 35.56,45.79 36.19,45.79 36.19,45.16 38.74,45.16 38.74,41.98 39.37,41.98 39.37,40.08 38.74,40.08 38.74,38.81 38.1,38.81 38.1,36.27 53.34,36.27 53.34,37.53 60.96,37.53 60.96,38.17 61.59,38.17 61.59,43.25 62.23,43.25 62.23,43.89 62.87,43.89 62.87,47.06 v1(74.93,47.06)
PA15: length 64.1
  Top Layer w0.25: U1.11 v1(74.93,45.79) 74.93,45.16 74.29,45.16 74.29,43.25 62.23,43.25 62.23,42.61 59.69,42.61 59.69,41.34 v1(38.1,41.34)
  Bottom Layer w0.25: v1(38.1,41.34) 38.1,44.52 35.56,44.52 35.56,45.16 34.93,45.16 34.93,45.79 29.21,45.79 H5.10
PB0: length 76.8
  In1.Cu w0.25: v1(37.47,66.11) 36.83,66.11 36.83,60.39 36.19,60.39 36.19,54.68 35.56,54.68 35.56,43.89 34.93,43.89 34.93,43.25 34.29,43.25 H4.8
  In2.Cu w0.25: v1(37.47,66.11) 45.09,66.11 45.09,66.75 79.38,66.75 J3.2
PB1: length 54
  Top Layer w0.25: H4.7 38.1,37.53 38.1,36.27 46.99,36.27 46.99,29.28 77.47,29.28 v1(77.47,31.82) U2.12
PB3: length 59.1
  Bottom Layer w0.25: J10.6 74.93,62.3 74.93,61.03 68.58,61.03 68.58,59.76 67.94,59.76 67.94,59.12 39.37,59.12 39.37,54.68 26.67,54.68 H5.11
PB4: length 67.9
  In1.Cu w0.25: v1(24.13,64.2) H5.12
  In2.Cu w0.25: v1(24.13,64.2) 78.74,64.2 J10.7
PB5: length 76.8
  Top Layer w0.25: v1(33.02,57.86) 43.81,57.86 43.81,58.49 59.06,58.49 59.06,59.12 67.31,59.12 v1(67.31,60.39) ; U1.14 v1(74.93,49.6)
  In1.Cu w0.25: v1(74.93,49.6) 76.2,49.6 76.2,57.86 75.56,57.86 75.56,58.49 67.31,58.49 v1(67.31,60.39)
  Bottom Layer w0.25: v1(33.02,57.86) 33.02,57.22 21.59,57.22 H5.13
PB6: length 98.4
  Top Layer w0.25: U2.16 v1(77.47,36.9) 78.1,36.9 78.1,36.27 78.74,36.27 78.74,28.64 46.35,28.64 46.35,29.28 21.59,29.28 21.59,28.64 v1(19.69,28.64)
  Bottom Layer w0.25: H5.14 19.05,38.81 20.32,38.81 20.32,35.63 19.69,35.63 v1(19.69,28.64)
PB7: length 92.1
  Top Layer w0.25: v1(57.78,55.31) 57.78,54.68 55.25,54.68 55.25,54.05 17.78,54.05 17.78,52.78 H5.15 ; U2.15 v1(77.47,35.63)
  Bottom Layer w0.25: v1(77.47,35.63) 76.2,35.63 76.2,57.86 75.56,57.86 75.56,58.49 57.78,58.49 v1(57.78,55.31)
PB8: length 75.6
  Top Layer w0.25: U1.16 v1(74.93,52.14)
  In1.Cu w0.25: v1(59.06,54.05) 59.06,58.49 60.96,58.49 60.96,57.86 63.5,57.86 63.5,52.14 v1(74.93,52.14)
  In2.Cu w0.25: H5.16 15.24,52.78 15.24,54.05 v1(59.06,54.05)
PB9: length 81.9
  Top Layer w0.25: U1.15 v1(74.93,50.87)
  In2.Cu w0.25: v1(11.43,57.22) 12.06,57.22 12.06,57.86 16.51,57.86 16.51,56.58 40.64,56.58 40.64,57.86 59.69,57.86 59.69,58.49 73.66,58.49 73.66,51.5 74.29,51.5 74.29,50.87 v1(74.93,50.87)
  Bottom Layer w0.25: v1(11.43,57.22) H5.17
PB10: length 55.2
  Top Layer w0.25: U1.18 v1(74.93,54.68)
  Bottom Layer w0.25: v1(74.93,54.68) 61.59,54.68 61.59,45.16 60.96,45.16 60.96,44.52 52.07,44.52 52.07,39.44 39.37,39.44 H4.6
PB11: length 51.4
  Top Layer w0.25: U1.17 v1(74.93,53.41)
  In2.Cu w0.25: H4.5 43.18,37.53 43.18,38.81 v1(60.32,38.81)
  Bottom Layer w0.25: v1(60.32,38.81) 60.32,43.89 61.59,43.89 61.59,44.52 62.23,44.52 62.23,53.41 v1(74.93,53.41)
PB12: length 57.8
  Bottom Layer w0.25: H5.1 52.07,54.05 27.94,54.05 27.94,51.5 20.32,51.5 20.32,56.58 19.69,56.58 19.69,57.22 19.05,57.22 19.05,66.75 18.42,66.75 18.42,68.02 17.14,68.02 17.14,69.28 J1.2
PB13: length 62.9
  Top Layer w0.25: U2.14 v1(77.47,34.36)
  In1.Cu w0.25: v1(58.42,31.82) 58.42,44.52 49.53,44.52 H5.2
  Bottom Layer w0.25: v1(58.42,31.82) 58.42,28.64 64.13,28.64 64.13,29.28 64.77,29.28 64.77,30.55 78.1,30.55 78.1,31.19 78.74,31.19 78.74,34.36 v1(77.47,34.36)
PB14: length 50.8
  Top Layer w0.25: H5.3 45.72,52.78 45.72,51.5 34.93,51.5 34.93,50.87 34.29,50.87 v1(34.29,50.23)
  In1.Cu w0.25: J2.2 46.99,69.28 46.99,68.02 34.29,68.02 34.29,57.22 33.66,57.22 33.66,56.58 33.02,56.58 33.02,51.5 34.29,51.5 v1(34.29,50.23)
PB15: length 62.9
  Top Layer w0.25: U2.13 v1(77.47,33.09)
  In1.Cu w0.25: v1(59.06,51.5) 59.06,35 59.69,35 v1(59.69,31.82)
  In2.Cu w0.25: v1(59.06,51.5) 45.72,51.5 45.72,52.78 H5.4
  Bottom Layer w0.25: v1(59.69,31.82) 59.69,29.28 63.5,29.28 63.5,29.92 64.13,29.92 64.13,33.09 v1(77.47,33.09)
PC13: length 83.2
  In1.Cu w0.25: v1(9.53,62.94) 8.89,62.94 8.89,57.86 8.25,57.86 8.25,54.68 7.62,54.68 7.62,51.5 6.35,51.5 H4.19
  In2.Cu w0.25: v1(9.53,62.94) 63.5,62.94 J10.1
PC14: length 83.2
  In2.Cu w0.25: v1(10.16,61.03) 16.51,61.03 16.51,60.39 66.04,60.39 J10.2
  Bottom Layer w0.25: v1(10.16,61.03) 10.16,51.5 8.89,51.5 H4.18
PC15: length 81.9
  Top Layer w0.25: J10.3 68.58,58.49 59.69,58.49 59.69,57.86 59.06,57.86 59.06,56.58 v1(12.7,56.58)
  Bottom Layer w0.25: v1(12.7,56.58) 12.7,51.5 11.43,51.5 H4.17
PGATE: length 20.3
  Top Layer w0.25: Q1.1 3.17,17.22 R8.1 ; D1.2 v1(13.97,13.41)
  In2.Cu w0.25: v1(13.97,13.41) 13.97,14.68 12.7,14.68 12.7,15.31 6.98,15.31 6.98,15.94 6.35,15.94 Q1.1
VADJ: length 32.4
  Bottom Layer w0.25: U3.4 47.62,7.69 71.12,7.69 R7.1
VM7V4: length 68.6
  Top Layer w0.25: R9.1 95.25,23.56 91.44,23.56 91.44,22.93 88.26,22.93 88.26,21.03 D2.1
  Top Layer w1.7: D2.1 J11.1
  Top Layer w2: C7.1 75.56,5.78
  Top Layer w3.2: U3.6 85.09,5.78 J11.1
  Bottom Layer w0.25: U3.5 50.8,3.25 66.68,3.25 U3.6

## Text on the board
Top Silkscreen Layer: D1 K FRONT | Q1 TAB D | 5V LOGIC | AIN1 AIN2 BIN1 BIN2 G | E1A E1B E2A E2B G | C7 + REAR | D2 K LEFT | PC13 | PC14 | PC15 | PA9 | PA10 | PB3 | PB4 | NRST | VBAT | 3V3 | GND | CORE LINK | 15.24mm ROWS | G TX RX | L + T E G | F + T E G | R + T E G | GND +5V CH1..8 | V5 / R03 | H5 FRONT / H4 REAR | VM 7.4V | + 7.4V OUT - | USB-C <   YB-MSA01 | + BAT IN - | PTN78020WAH | FRONT
